# Altium schematic sheet Child.SchDoc
size A4
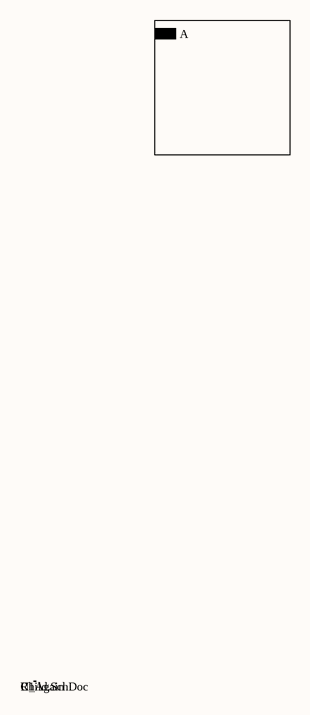
[diagram p0: Child.SchDoc]

## Parts
R1  (no value)

## Sub-sheets
U_Again = Child.SchDoc: A

## Nets

Not connected (* = marked no-connect by the designer): R1 1(A)

## Library data of the parts
R1 = RES